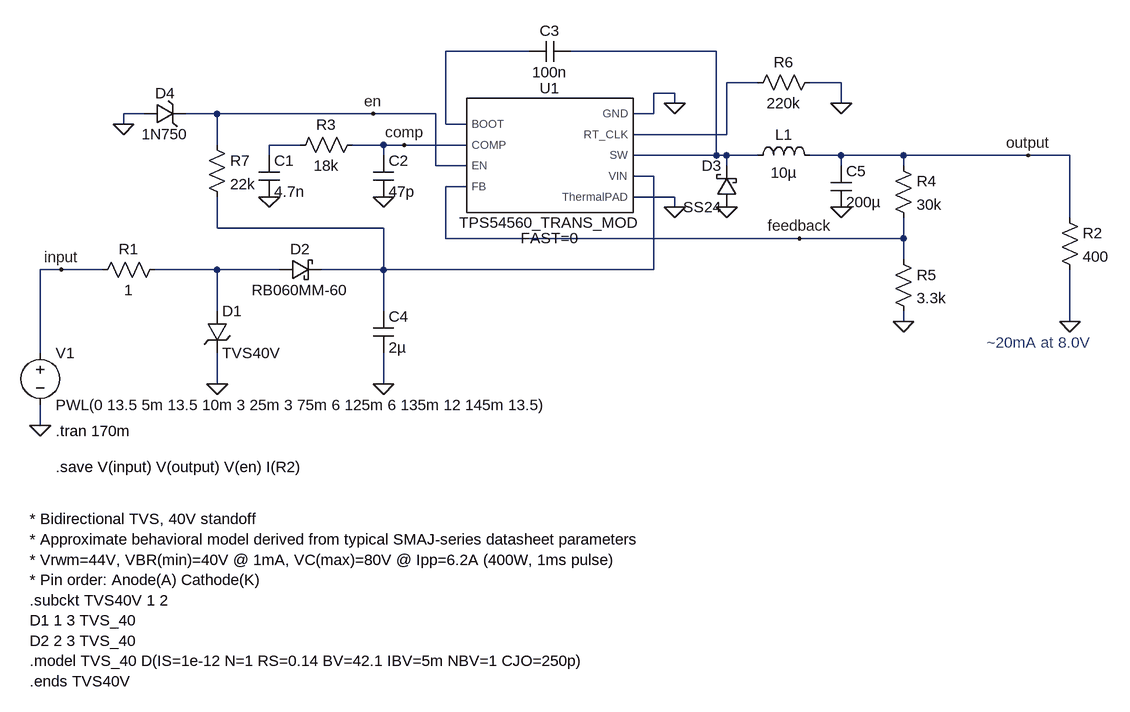
[diagram p0: schematic TPS54560_crank_drop.asc]
TPS54560_crank_drop.asc, the LTspice schematic file:
Version 4.1
SHEET 1 1672 748
WIRE 352 -464 224 -464
WIRE 640 -464 416 -464
WIRE 704 -416 656 -416
WIRE 832 -416 784 -416
WIRE 576 -400 544 -400
WIRE 576 -384 576 -400
WIRE 832 -384 832 -416
WIRE -240 -368 -272 -368
WIRE -128 -368 -176 -368
WIRE 112 -368 -128 -368
WIRE 208 -368 112 -368
WIRE 544 -368 544 -400
WIRE 544 -368 512 -368
WIRE -272 -352 -272 -368
WIRE 224 -352 224 -464
WIRE 256 -352 224 -352
WIRE 656 -336 656 -416
WIRE 656 -336 512 -336
WIRE -128 -320 -128 -368
WIRE 0 -320 -48 -320
WIRE 128 -320 80 -320
WIRE 160 -320 128 -320
WIRE 256 -320 160 -320
WIRE -48 -304 -48 -320
WIRE 128 -304 128 -320
WIRE 640 -304 640 -464
WIRE 640 -304 512 -304
WIRE 656 -304 640 -304
WIRE 704 -304 656 -304
WIRE 832 -304 784 -304
WIRE 928 -304 832 -304
WIRE 1120 -304 928 -304
WIRE 1184 -304 1120 -304
WIRE 208 -288 208 -368
WIRE 256 -288 208 -288
WIRE 656 -288 656 -304
WIRE 832 -288 832 -304
WIRE 928 -288 928 -304
WIRE 544 -272 512 -272
WIRE 256 -256 224 -256
WIRE 576 -240 512 -240
WIRE 576 -224 576 -240
WIRE 1184 -208 1184 -304
WIRE -128 -192 -128 -240
WIRE 128 -192 -128 -192
WIRE 224 -176 224 -256
WIRE 768 -176 224 -176
WIRE 928 -176 928 -208
WIRE 928 -176 768 -176
WIRE 928 -144 928 -176
WIRE -368 -128 -400 -128
WIRE -304 -128 -368 -128
WIRE -128 -128 -224 -128
WIRE -32 -128 -128 -128
WIRE 128 -128 128 -192
WIRE 128 -128 32 -128
WIRE 544 -128 544 -272
WIRE 544 -128 128 -128
WIRE -128 -64 -128 -128
WIRE 128 -64 128 -128
WIRE 928 -48 928 -64
WIRE 1184 -48 1184 -128
WIRE -400 0 -400 -128
WIRE -128 48 -128 0
WIRE 128 48 128 0
WIRE -400 112 -400 80
FLAG -128 48 0
FLAG -400 112 0
FLAG 1184 -48 0
FLAG -368 -128 input
FLAG 128 48 0
FLAG 1120 -304 output
FLAG 128 -240 0
FLAG -48 -240 0
FLAG 928 -48 0
FLAG 832 -224 0
FLAG 768 -176 feedback
FLAG 576 -224 0
FLAG 656 -224 0
FLAG 576 -384 0
FLAG 832 -384 0
FLAG 160 -320 comp
FLAG -272 -352 0
FLAG 112 -368 en
SYMBOL res -208 -144 R90
WINDOW 0 0 56 VBottom 2
WINDOW 3 32 56 VTop 2
SYMATTR InstName R1
SYMATTR Value 1
SYMBOL TVSdiode -144 -64 R0
SYMATTR InstName D1
SYMATTR Value TVS40V
SYMATTR Prefix X
SYMBOL res 1168 -224 R0
SYMATTR InstName R2
SYMATTR Value 400
SYMBOL schottky -32 -112 R270
WINDOW 0 32 32 VTop 2
WINDOW 3 0 32 VBottom 2
SYMATTR InstName D2
SYMATTR Value RB060MM-60
SYMATTR Description Diode
SYMATTR Type diode
SYMBOL voltage -400 -16 R0
WINDOW 123 0 0 Left 0
WINDOW 39 0 0 Left 0
SYMATTR InstName V1
SYMATTR Value PWL(0 13.5 5m 13.5 10m 3 25m 3 75m 6 125m 6 135m 12 145m 13.5)
SYMBOL cap 112 -64 R0
SYMATTR InstName C4
SYMATTR Value 2µ
SYMBOL res -16 -304 R270
WINDOW 0 32 56 VTop 2
WINDOW 3 0 56 VBottom 2
SYMATTR InstName R3
SYMATTR Value 18k
SYMBOL cap -64 -304 R0
SYMATTR InstName C1
SYMATTR Value 4.7n
SYMBOL cap 112 -304 R0
SYMATTR InstName C2
SYMATTR Value 47p
SYMBOL ind 688 -288 R270
WINDOW 0 32 56 VTop 2
WINDOW 3 5 56 VBottom 2
SYMATTR InstName L1
SYMATTR Value 10µ
SYMATTR SpiceLine Rser=1m
SYMBOL cap 816 -288 R0
SYMATTR InstName C5
SYMATTR Value 200µ
SYMBOL res 912 -304 R0
SYMATTR InstName R4
SYMATTR Value 30k
SYMBOL res 912 -160 R0
SYMATTR InstName R5
SYMATTR Value 3.3k
SYMBOL schottky 672 -224 R180
WINDOW 0 24 64 Left 2
WINDOW 3 24 0 Left 2
SYMATTR InstName D3
SYMATTR Value SS24
SYMATTR Description Diode
SYMATTR Type diode
SYMBOL cap 416 -480 R90
WINDOW 0 0 32 VBottom 2
WINDOW 3 32 32 VTop 2
SYMATTR InstName C3
SYMATTR Value 100n
SYMBOL res 800 -432 R90
WINDOW 0 0 56 VBottom 2
WINDOW 3 32 56 VTop 2
SYMATTR InstName R6
SYMATTR Value 220k
SYMBOL TPS54560_TRANS_MOD 384 -304 R0
SYMATTR InstName U1
SYMBOL res -144 -336 R0
SYMATTR InstName R7
SYMATTR Value 22k
SYMBOL zener -240 -352 R270
WINDOW 0 32 32 VTop 2
WINDOW 3 0 32 VBottom 2
SYMATTR InstName D4
SYMATTR Value 1N750
SYMATTR Description Diode
SYMATTR Type diode
TEXT -416 256 Left 2 !* Bidirectional TVS, 40V standoff\n* Approximate behavioral model derived from typical SMAJ-series datasheet parameters\n* Vrwm=44V, VBR(min)=40V @ 1mA, VC(max)=80V @ Ipp=6.2A (400W, 1ms pulse)\n* Pin order: Anode(A) Cathode(K)\n.subckt TVS40V 1 2\nD1 1 3 TVS_40\nD2 2 3 TVS_40\n.model TVS_40 D(IS=1e-12 N=1 RS=0.14 BV=42.1 IBV=5m NBV=1 CJO=250p)\n.ends TVS40V
TEXT -376 120 Left 2 !.tran 170m
TEXT 1056 -16 Left 2 ;~20mA at 8.0V
TEXT -376 176 Left 2 !.save V(input) V(output) V(en) I(R2)

The netlist it stands for:
* TPS54560_crank_drop.asc
R1 N006 input 1
X§D1 N006 0 TVS40V  ; pins + -
R2 output 0 400
D2 N006 N005 RB060MM-60
V1 input 0 PWL(0 13.5 5m 13.5 10m 3 25m 3 75m 6 125m 6 135m 12 145m 13.5)
C4 N005 0 2µ
R3 N004 comp 18k
C1 N004 0 4.7n
C2 comp 0 47p
L1 N002 output 10µ Rser=1m
C5 output 0 200µ
R4 output feedback 30k
R5 feedback 0 3.3k
D3 0 N002 SS24
C3 N002 N001 100n
R6 0 N003 220k
X§U1 N001 comp en feedback 0 N003 N002 N005 0 TPS54560_TRANS_MOD FAST=0  ; pins BOOT COMP EN FB GND RT_CLK SW VIN ThermalPAD
R7 en N005 22k
D4 0 en 1N750
.model D D
.lib standard.dio
* Bidirectional TVS, 40V standoff
* Approximate behavioral model derived from typical SMAJ-series datasheet parameters
* Vrwm=44V, VBR(min)=40V @ 1mA, VC(max)=80V @ Ipp=6.2A (400W, 1ms pulse)
* Pin order: Anode(A) Cathode(K)
.subckt TVS40V 1 2
D1 1 3 TVS_40
D2 2 3 TVS_40
.model TVS_40 D(IS=1e-12 N=1 RS=0.14 BV=42.1 IBV=5m NBV=1 CJO=250p)
.ends TVS40V
.tran 170m
* ~20mA at 8.0V
.save V(input) V(output) V(en) I(R2)
.lib TPS54560_TRANS_MOD.LIB
.backanno
.end